# Altium project DTU_LiPo_Charger_v1.0.PrjPcb
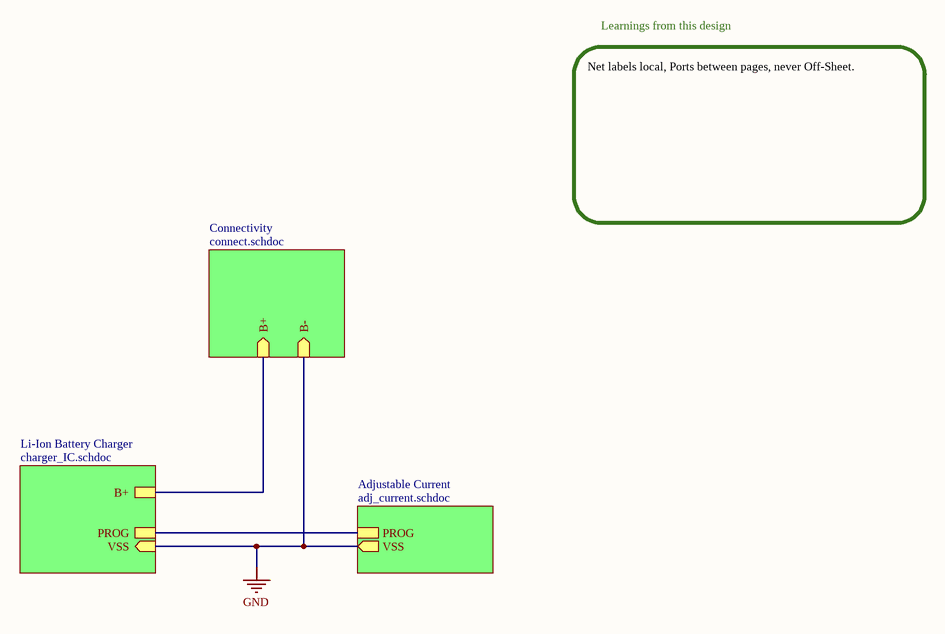
[diagram p0: Top.SchDoc]
4 sheets, 19 parts. Net scope: hierarchical (ports join the sheet entries above them; power ports are global).
Board file: DTU_LiPo_Charger_v1.0.PcbDoc
Sheets:
  Top.SchDoc
    Li-Ion Battery Charger = charger_IC.SchDoc
    Connectivity = connect.SchDoc
    Adjustable Current = adj_current.SchDoc

## Sheet Top.SchDoc
size A; SheetNumber: 1; SheetTotal: 4

### Sub-sheets
Adjustable Current = adj_current.schdoc: PROG, VSS (out)
Connectivity = connect.schdoc: B+ (in), B- (in)
Li-Ion Battery Charger = charger_IC.schdoc: B+, PROG, VSS (in)

### Nets
GND: sheet Li-Ion Battery Charger/VSS, sheet Connectivity/B-, sheet Adjustable Current/VSS
PROG: sheet Li-Ion Battery Charger/PROG, sheet Adjustable Current/PROG
VBAT: sheet Li-Ion Battery Charger/B+, sheet Connectivity/B+

### Notes on the sheet
- Net labels local, Ports between pages, never Off‑Sheet.
- Learnings from this design

## Sheet charger_IC.SchDoc
size A; SheetNumber: 3; SheetTotal: 4
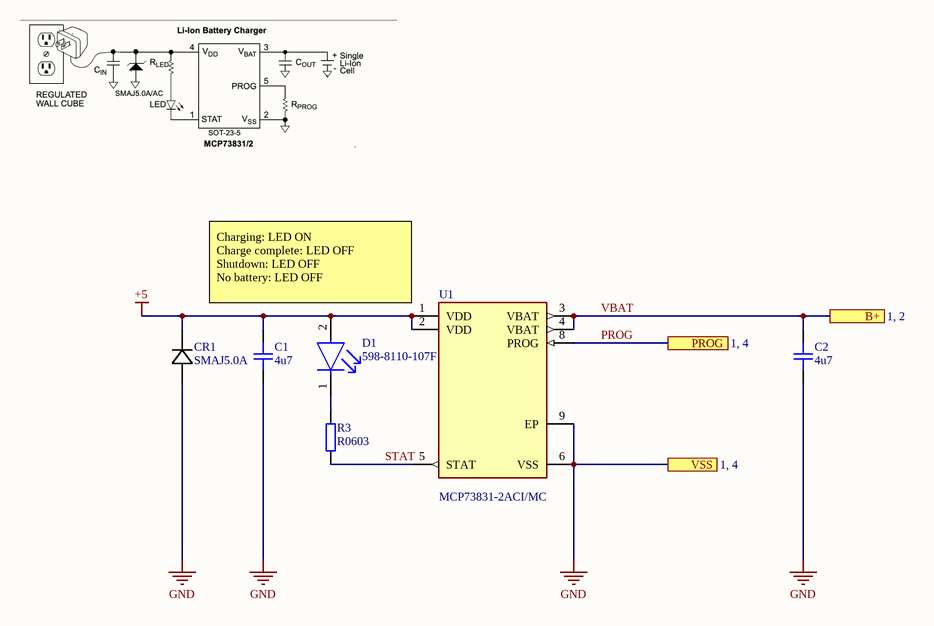
[diagram p1: charger_IC.SchDoc]

### Parts
C1  4u7  [CAP_0603]
C2  4u7  [CAP_0603]
CR1  SMAJ5.0A  [SMASeries_LTF-M]
D1  598-8110-107F  [RED_LED_0805]
R3  R0603  [RES_0603]
U1  MCP73831-2ACI/MC  [SON50P200X300X100-9N]

### Ports
B+ (see 1, 2), PROG (see 1, 4), VSS (see 1, 4)

### Nets
+5: C1.2 CR1.1 D1.2(A) U1.1(VDD) U1.2(VDD)
GND: C1.1 C2.1 CR1.2 U1.6(VSS) U1.9(EP) ; port VSS
PROG: U1.8(PROG) ; port PROG
STAT: R3.1 U1.5(STAT)
VBAT: C2.2 U1.3(VBAT) U1.4(VBAT) ; port B+
NetD1_1: D1.1(C) R3.2

### Notes on the sheet
- Charging: LED ON
  Charge complete: LED OFF
  Shutdown: LED OFF
  No battery: LED OFF

### Library data of the parts
C1 C2 = CAP_0603: Capacitor SMD 0603 / Ceramic; Manufacturer: *; Manufacturer Part Number: *; Distributor Link: *; LCSC: *; Rating: *; Dielectric: *
CR1 = SMAJ5.0A: ESD Protection Diode; Manufacturer_Name: Littelfuse Inc; Copyright: Copyright (C) 2025 Ultra Librarian. All rights reserved.; Manufacturer_Part_Number: SMAJ5.0A
D1 = RED_LED_0805: 598-8110-107F 598-8110-107F, Dialight, SMD LED 0805 Package, Red Single color SOLD IN INCREMENTS OF 4000. (REEL); NexarPartId: 868569; Wavelength: 635nm; Forward Current: 20mA; Lens Style: Clear; Forward Voltage: 2.2V; Power Dissipation: 60mW; Max Junction Temperature (Tj): 105°C; Luminous Intensity: 40mcd; Viewing Angle: 140°; Reverse Voltage: 5V; Number of LEDs: 1; Number of Pins: 2; Schedule B: 8541402000, 8541402000|8541402000, 8541402000|8541402000|8541402000, 8541402000|8541402000|8541402000|8541402000; Length: 2mm; Width: 1.25mm; Mount: Surface Mount; Height: 800µm; Case Code (Imperial): 0805; Case Code (Metric): 2012; RoHS: Compliant; Min Operating Temperature: -30°C; Color: Red; Case/Package: 0805; Depth: 1.25mm; Lead Free: Lead Free; Max Operating Temperature: 85°C; Test Current: 20mA; Illumination Color: Red; Number of Elements: 1; Dominant Wavelength: 635nm; REACH SVHC: No SVHC; Radiation Hardening: No
R3 = RES_0603: Resistor SMD 0603; Manufacturer: *; Manufacturer Part Number: *; Distributor Link: *; LCSC: *
U1 = MCP73831-2ACI/MC: Charge Controller Li-Ion/Li-Pol 15mA to 500mA 4.2V 8-Pin DFN EP | Microchip Technology Inc. MCP73831-2ACI/MC; SnapEDA_Link: https://www.snapeda.com/parts/MCP73831-2ACI/MC/Microchip/view-part/?ref=snap; Package: VFDFN-8 Microchip; Value: *; MF: Microchip; MP: MCP73831-2ACI/MC; Check_prices: https://www.snapeda.com/parts/MCP73831-2ACI/MC/Microchip/view-part/?ref=eda

## Sheet connect.SchDoc
size A; SheetNumber: 2; SheetTotal: 4
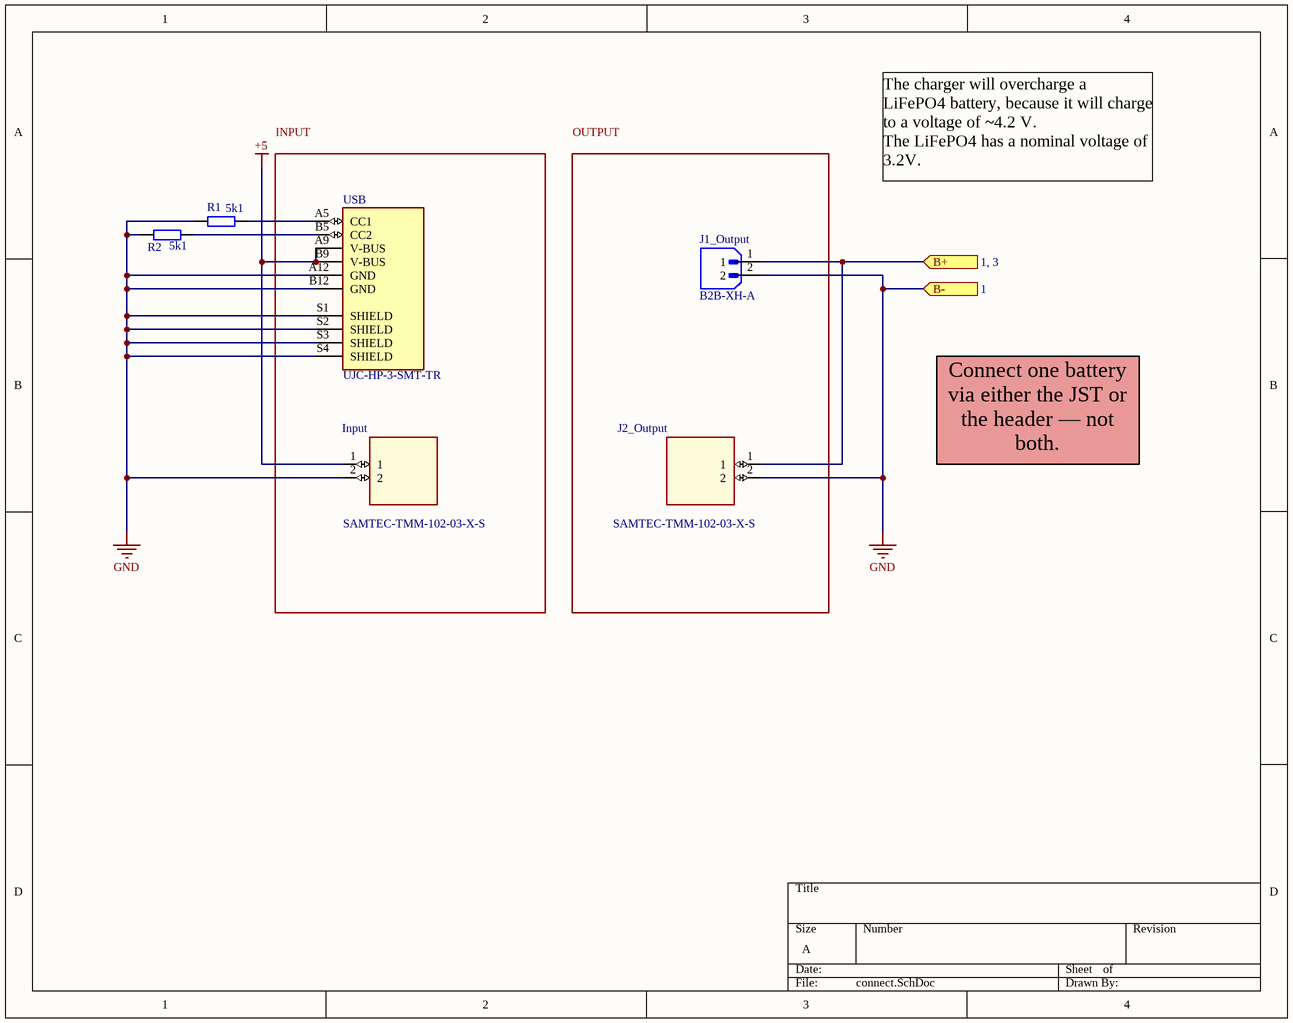
[diagram p2: connect.SchDoc]

### Parts
Input  SAMTEC-TMM-102-03-X-S  [SAMTEC-TMM-102-03-X-S]
J1_Output  B2B-XH-A  [JST_B2B-XH-A]
J2_Output  SAMTEC-TMM-102-03-X-S  [SAMTEC-TMM-102-03-X-S]
R1  5k1  [RES_0603]
R2  5k1  [RES_0603]
USB  UJC-HP-3-SMT-TR  [CUI_UJC-HP-3-SMT-TR]

### Blocks framed on the sheet
INPUT: Input USB
OUTPUT: J1_Output J2_Output

### Ports
B+ (in, see 1, 3), B- (in, see 1)

### Nets
+5: Input.1 USB.A9(V-BUS) USB.B9(V-BUS)
GND: Input.2 J1_Output.2 J2_Output.2 R1.1 R2.1 USB.A12(GND) USB.B12(GND) USB.S1(SHIELD) USB.S2(SHIELD) USB.S3(SHIELD) USB.S4(SHIELD) ; port B-
VBAT: J1_Output.1 J2_Output.1 ; port B+
NetR1_2: R1.2 USB.A5(CC1)
NetR2_2: R2.2 USB.B5(CC2)

### Notes on the sheet
- The charger will overcharge a LiFePO4 battery, because it will charge to a voltage of ~4.2 V.
  The LiFePO4 has a nominal voltage of 3.2V.
- Connect one battery via either the JST or the header — not both.

### Library data of the parts
J1_Output = B2B-XH-A: MF: {'manufacturer': u'JST Sales America Inc.'}; Package: None; Price: None; Value: *; MP: B2B-XH-A; Availability: Unavailable
R1 R2 = RES_0603: Resistor SMD 0603; Manufacturer: *; Manufacturer Part Number: *; Distributor Link: *; LCSC: *
Input J2_Output = SAMTEC-TMM-102-03-X-S: Price: None; Value: *; MP: SAMTEC-TMM-102-03-X-S; Availability: Unavailable; Package: None
USB = UJC-HP-3-SMT-TR: Package: None; Price: None; Value: *; MP: UJC-HP-3-SMT-TR; Availability: Unavailable

## Sheet adj_current.SchDoc
size A; SheetNumber: 4; SheetTotal: 4
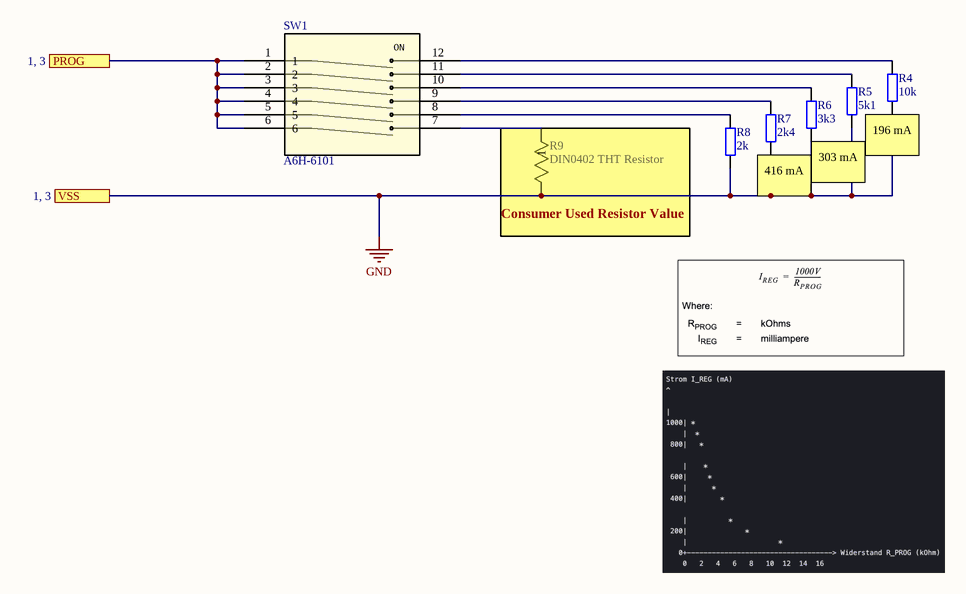
[diagram p3: adj_current.SchDoc]

### Parts
R4  10k  [RES_0603]
R5  5k1  [RES_0603]
R6  3k3  [RES_0603]
R7  2k4  [RES_0603]
R8  2k  [RES_0603]
R9  DIN0402 THT Resistor  [DIN0207 THT Resistor]
SW1  A6H-6101  [SW_A6H-6101_OMR]

### Blocks framed on the sheet
Consumer Used Resistor Value: R9

### Ports
PROG (see 1, 3), VSS (see 1, 3)

### Nets
GND: R4.2 R5.2 R6.2 R7.2 R8.2 R9.2 ; port VSS
PROG: SW1.1 SW1.2 SW1.3 SW1.4 SW1.5 SW1.6 ; port PROG
NetR4_1: R4.1 SW1.12
NetR5_1: R5.1 SW1.11
NetR6_1: R6.1 SW1.10
NetR7_1: R7.1 SW1.9
NetR8_1: R8.1 SW1.8
NetR9_1: R9.1 SW1.7

### Notes on the sheet
- (near R7) 416 mA
- (near R6) 303 mA
- 196 mA
- (in symbol A6H-6101) ON

### Library data of the parts
R4-R8 = RES_0603: Resistor SMD 0603; Manufacturer: *; Manufacturer Part Number: *; Distributor Link: *; LCSC: *
R9 = DIN0402 THT Resistor: Description; Manufacturer_Name: Stackpole International; Manufacturer_Part_Number: CF14JT1K00; Copyright: Copyright (C) 2025 Ultra Librarian. All rights reserved.
SW1 = A6H-6101: Description; Manufacturer_Name: Omron; Copyright: Copyright (C) 2025 Ultra Librarian. All rights reserved.; Manufacturer_Part_Number: A6H-6101; RefDes: RefDes; Type: Type

## Nets that join several sheets
+5: charger_IC (5 pins), connect (Input.1 USB.A9 USB.B9)
GND: charger_IC (5 pins), connect (11 pins), adj_current (6 pins)
PROG: charger_IC (U1.8), adj_current (6 pins)
VBAT: charger_IC (C2.2 U1.3 U1.4), connect (J1_Output.1 J2_Output.1)